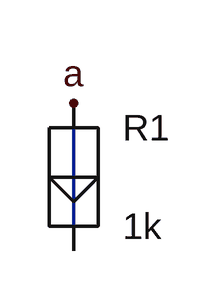
[diagram p0: schematic same_instance_ground_inside.asc]
same_instance_ground_inside.asc, the LTspice schematic file:
Version 4
SHEET 1 880 680
WIRE 96 96 96 192
FLAG 96 96 a
FLAG 96 144 0
SYMBOL res 96 144 R0
SYMATTR InstName R1
SYMATTR Value 1k

The netlist it stands for:
* same_instance_ground_inside.asc
R1 0 0 1k
.backanno
.end